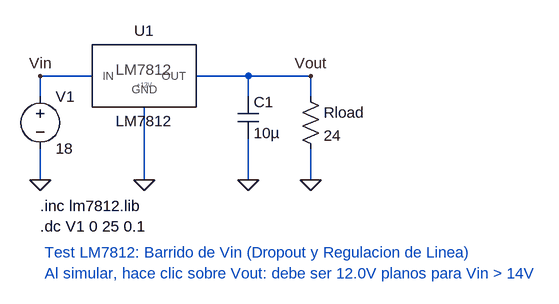
[diagram p0: schematic test_lm7812.asc]
test_lm7812.asc, the LTspice schematic file:
Version 4
SHEET 1 900 600
WIRE -80 0 -160 0
WIRE 160 0 80 0
WIRE 256 0 160 0
WIRE -160 32 -160 0
WIRE 160 32 160 0
WIRE 256 32 256 0
WIRE -160 160 -160 112
WIRE 0 160 0 48
WIRE 160 160 160 96
WIRE 256 160 256 112
FLAG -160 160 0
FLAG 0 160 0
FLAG 160 160 0
FLAG 256 160 0
FLAG -160 0 Vin
FLAG 256 0 Vout
SYMBOL LM7812 0 0 R0
SYMATTR InstName U1
SYMBOL voltage -160 16 R0
WINDOW 123 0 0 Left 0
WINDOW 39 0 0 Left 0
SYMATTR InstName V1
SYMATTR Value 18
SYMBOL cap 144 32 R0
SYMATTR InstName C1
SYMATTR Value 10µ
SYMBOL res 240 16 R0
SYMATTR InstName Rload
SYMATTR Value 24
TEXT -160 200 Left 2 !.inc lm7812.lib
TEXT -160 232 Left 2 !.dc V1 0 25 0.1
TEXT -160 272 Left 2 ; Test LM7812: Barrido de Vin (Dropout y Regulacion de Linea)
TEXT -160 304 Left 2 ; Al simular, hace clic sobre Vout: debe ser 12.0V planos para Vin > 14V

The netlist it stands for:
* test_lm7812.asc
XU1 Vin 0 Vout LM7812  ; pins IN GND OUT
V1 Vin 0 18
C1 Vout 0 10µ
Rload Vout 0 24
.inc lm7812.lib
.dc V1 0 25 0.1
*  Test LM7812: Barrido de Vin (Dropout y Regulacion de Linea)
*  Al simular, hace clic sobre Vout: debe ser 12.0V planos para Vin > 14V
.lib lm7812.lib
.backanno
.end